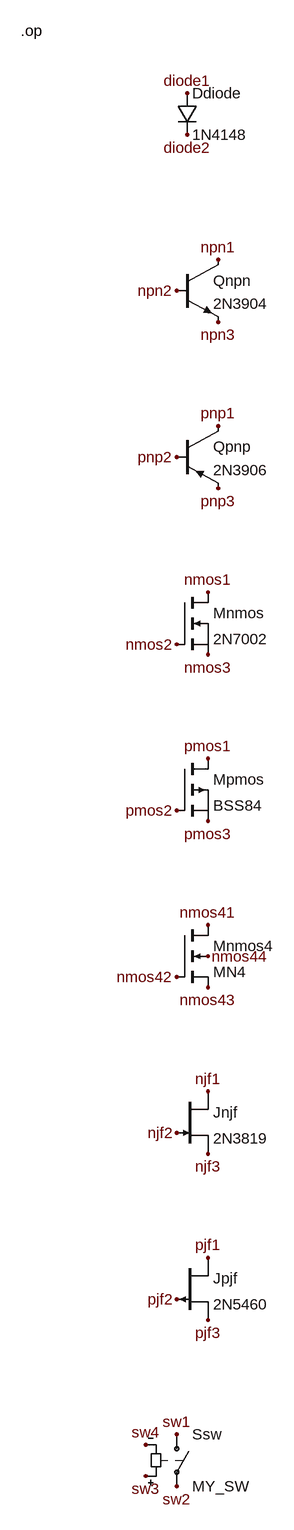
[diagram p0: schematic selected.asc]
selected.asc, the LTspice schematic file:
Version 4
SHEET 1 4000 3000
FLAG 272 128 diode1
FLAG 272 192 diode2
SYMBOL diode 256 128 R0
SYMATTR InstName Ddiode
SYMATTR Value 1N4148
FLAG 320 384 npn1
FLAG 256 432 npn2
FLAG 320 480 npn3
SYMBOL npn 256 384 R0
SYMATTR InstName Qnpn
SYMATTR Value 2N3904
FLAG 320 640 pnp1
FLAG 256 688 pnp2
FLAG 320 736 pnp3
SYMBOL pnp 256 640 R0
SYMATTR InstName Qpnp
SYMATTR Value 2N3906
FLAG 304 896 nmos1
FLAG 256 976 nmos2
FLAG 304 992 nmos3
SYMBOL nmos 256 896 R0
SYMATTR InstName Mnmos
SYMATTR Value 2N7002
FLAG 304 1152 pmos1
FLAG 256 1232 pmos2
FLAG 304 1248 pmos3
SYMBOL pmos 256 1152 R0
SYMATTR InstName Mpmos
SYMATTR Value BSS84
FLAG 304 1408 nmos41
FLAG 256 1488 nmos42
FLAG 304 1504 nmos43
FLAG 304 1456 nmos44
SYMBOL nmos4 256 1408 R0
SYMATTR InstName Mnmos4
SYMATTR Value MN4
FLAG 304 1664 njf1
FLAG 256 1728 njf2
FLAG 304 1760 njf3
SYMBOL njf 256 1664 R0
SYMATTR InstName Jnjf
SYMATTR Value 2N3819
FLAG 304 1920 pjf1
FLAG 256 1984 pjf2
FLAG 304 2016 pjf3
SYMBOL pjf 256 1920 R0
SYMATTR InstName Jpjf
SYMATTR Value 2N5460
FLAG 256 2192 sw1
FLAG 256 2272 sw2
FLAG 208 2256 sw3
FLAG 208 2208 sw4
SYMBOL sw 256 2176 R0
SYMATTR InstName Ssw
SYMATTR Value MY_SW
TEXT 16 32 Left 2 !.op

The netlist it stands for:
* selected.asc
Ddiode diode1 diode2 1N4148
Qnpn npn1 npn2 npn3 0 2N3904
Qpnp pnp1 pnp2 pnp3 0 2N3906
Mnmos nmos1 nmos2 nmos3 nmos3 2N7002
Mpmos pmos1 pmos2 pmos3 pmos3 BSS84
Mnmos4 nmos41 nmos42 nmos43 nmos44 MN4
Jnjf njf1 njf2 njf3 2N3819
Jpjf pjf1 pjf2 pjf3 2N5460
Ssw sw1 sw2 sw3 sw4 MY_SW
.model D D
.lib standard.dio
.model NPN NPN
.model PNP PNP
.lib standard.bjt
.model NJF NJF
.model PJF PJF
.lib standard.jft
.model NMOS NMOS
.model PMOS PMOS
.lib standard.mos
.op
.backanno
.end